# Altium schematic sheet CONNECTOR_DBG.SchDoc: CONNECTOR
size A4; Revision: V2.0; SheetNumber: 6; SheetTotal: 7; Project: PY32F403v1xT_START
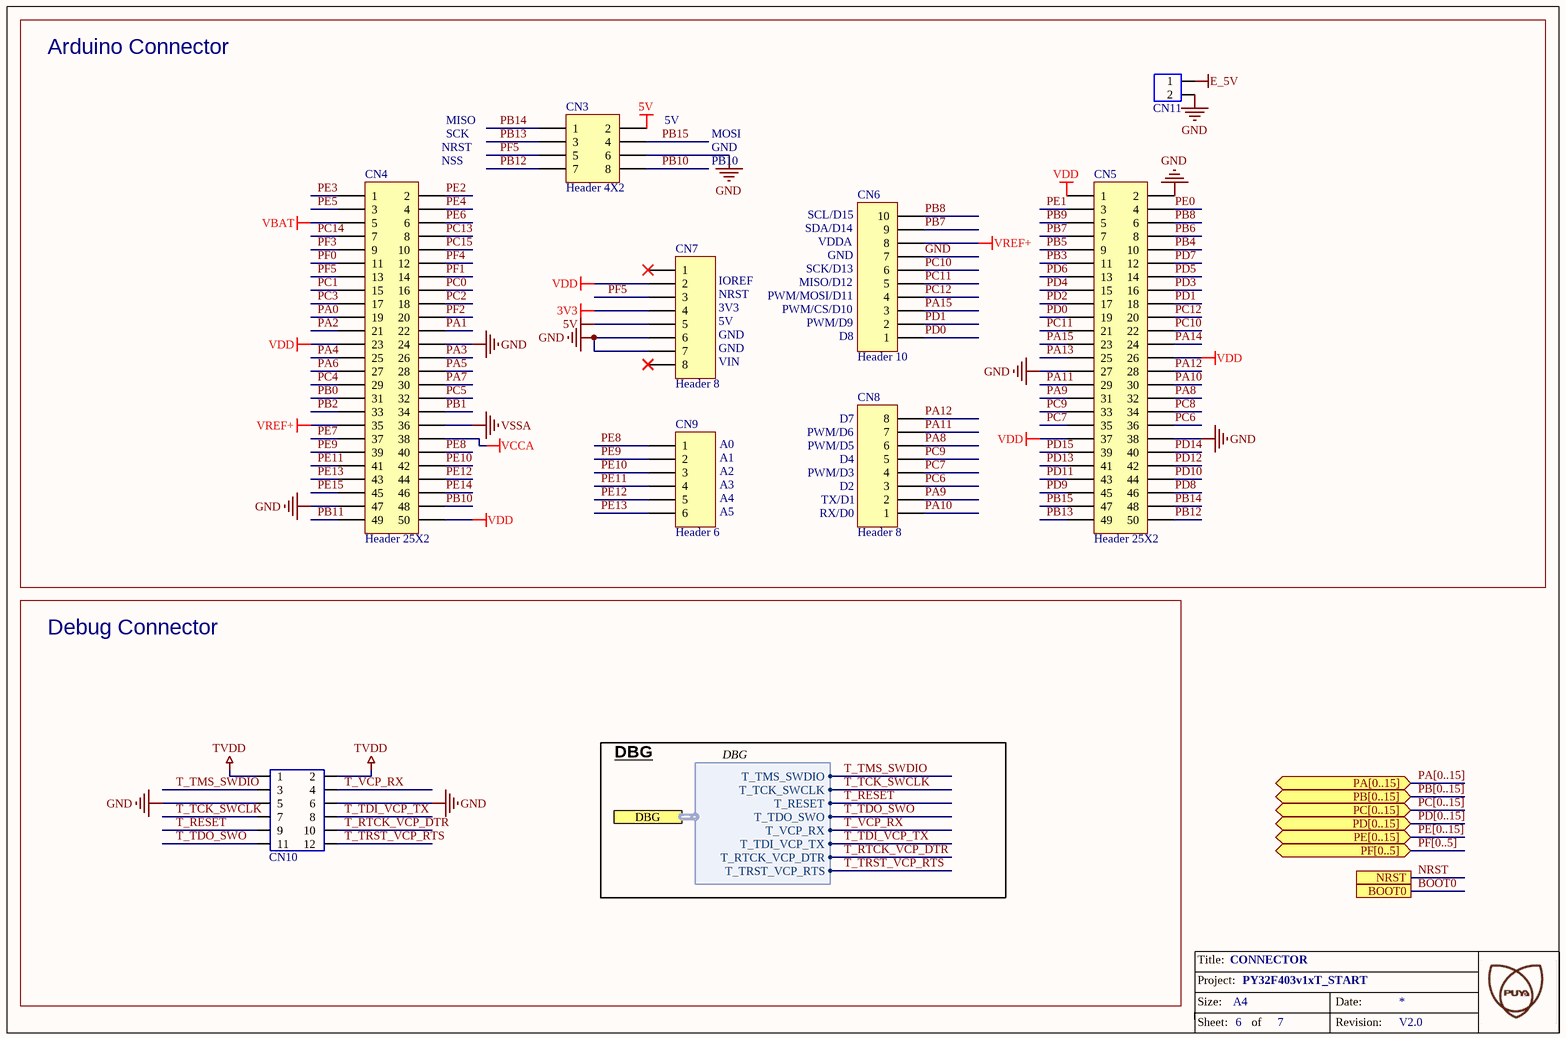
[diagram p0: CONNECTOR_DBG.SchDoc]

## Parts
CN3  Header 4X2  [HDR2X4]
CN4  Header 25X2  [HDR2X25]
CN5  Header 25X2  [HDR2X25]
CN6  Header 10  [1*10P_FEMALE]
CN7  Header 8  [1*8P_FEMALE]
CN8  Header 8  [1*8P_FEMALE]
CN9  Header 6  [1*6P_FEMALE]
CN10  CON6x2  [CON6x2]  (value not drawn)
CN11  CON2  [CON2]  (value not drawn)

## Blocks framed on the sheet
Arduino Connector: CN3-CN9 CN11
Debug Connector: CN10

## Ports
BOOT0, DBG (harness DBG), NRST, PA[0..15] (bidir), PB[0..15] (bidir), PC[0..15] (bidir), PD[0..15] (bidir), PE[0..15] (bidir), PF[0..5] (bidir)

## Harnesses
DBG: T_VCP_RX, T_TDO_SWO, T_RESET, T_TMS_SWDIO, T_TDI_VCP_TX, T_TCK_SWCLK, T_RTCK_VCP_DTR, T_TRST_VCP_RTS

## Nets
3V3: CN7.4
5V: CN3.2 CN7.5
E_5V: CN11.1
GND: CN3.6 CN4.24 CN4.47 CN5.2 CN5.27 CN5.38 CN6.7 CN7.6 CN7.7 CN10.5 CN10.6 CN11.2
TVDD: CN10.1 CN10.2
VBAT: CN4.5
VCCA: CN4.38
VDD: CN4.23 CN4.50 CN5.1 CN5.26 CN5.37 CN7.2
VREF+: CN4.35 CN6.8
VSSA: CN4.36
BOOT0: port BOOT0
NRST: port NRST
PA0: CN4.19
PA1: CN4.22
PA2: CN4.21
PA3: CN4.26
PA4: CN4.25
PA5: CN4.28
PA6: CN4.27
PA7: CN4.30
PA8: CN5.32 CN8.6
PA9: CN5.31 CN8.2
PA10: CN5.30 CN8.1
PA11: CN5.29 CN8.7
PA12: CN5.28 CN8.8
PA13: CN5.25
PA14: CN5.24
PA15: CN5.23 CN6.3
PB0: CN4.31
PB1: CN4.34
PB2: CN4.33
PB3: CN5.11
PB4: CN5.10
PB5: CN5.9
PB6: CN5.8
PB7: CN5.7 CN6.9
PB8: CN5.6 CN6.10
PB9: CN5.5
PB10: CN3.8 CN4.48
PB11: CN4.49
PB12: CN3.7 CN5.50
PB13: CN3.3 CN5.49
PB14: CN3.1 CN5.48
PB15: CN3.4 CN5.47
PC0: CN4.16
PC1: CN4.15
PC2: CN4.18
PC3: CN4.17
PC4: CN4.29
PC5: CN4.32
PC6: CN5.36 CN8.3
PC7: CN5.35 CN8.4
PC8: CN5.34
PC9: CN5.33 CN8.5
PC10: CN5.22 CN6.6
PC11: CN5.21 CN6.5
PC12: CN5.20 CN6.4
PC13: CN4.8
PC14: CN4.7
PC15: CN4.10
PD0: CN5.19 CN6.1
PD1: CN5.18 CN6.2
PD2: CN5.17
PD3: CN5.16
PD4: CN5.15
PD5: CN5.14
PD6: CN5.13
PD7: CN5.12
PD8: CN5.46
PD9: CN5.45
PD10: CN5.44
PD11: CN5.43
PD12: CN5.42
PD13: CN5.41
PD14: CN5.40
PD15: CN5.39
PE0: CN5.4
PE1: CN5.3
PE2: CN4.2
PE3: CN4.1
PE4: CN4.4
PE5: CN4.3
PE6: CN4.6
PE7: CN4.37
PE8: CN4.40 CN9.1
PE9: CN4.39 CN9.2
PE10: CN4.42 CN9.3
PE11: CN4.41 CN9.4
PE12: CN4.44 CN9.5
PE13: CN4.43 CN9.6
PE14: CN4.46
PE15: CN4.45
PF0: CN4.11
PF1: CN4.14
PF2: CN4.20
PF3: CN4.9
PF4: CN4.12
PF5: CN3.5 CN4.13 CN7.3
T_RESET: CN10.9 ; port DBG.T_RESET
T_RTCK_VCP_DTR: CN10.10 ; port DBG.T_RTCK_VCP_DTR
T_TCK_SWCLK: CN10.7 ; port DBG.T_TCK_SWCLK
T_TDI_VCP_TX: CN10.8 ; port DBG.T_TDI_VCP_TX
T_TDO_SWO: CN10.11 ; port DBG.T_TDO_SWO
T_TMS_SWDIO: CN10.3 ; port DBG.T_TMS_SWDIO
T_TRST_VCP_RTS: CN10.12 ; port DBG.T_TRST_VCP_RTS
T_VCP_RX: CN10.4 ; port DBG.T_VCP_RX

Not connected (* = marked no-connect by the designer): CN7 1* 8*

## Buses and harness runs
bus PA[0..15] = port PA[0..15]
bus PB[0..15] = port PB[0..15]
bus PC[0..15] = port PC[0..15]
bus PD[0..15] = port PD[0..15]
bus PE[0..15] = port PE[0..15]
bus PF[0..5] = port PF[0..5]

## Notes on the sheet
- (near CN4) NRST
- (near CN4) NSS
- MISO
- SCK
- (near CN3) 5V
- MOSI
- GND
- PB10
- (near CN6) SDA/D14
- (near CN6) SCL/D15
- VDDA
- (near CN7) IOREF
- (near CN7) NRST
- (near CN7) 3V3
- PWM/MOSI/D11
- PWM/CS/D10
- (near CN6) MISO/D12
- (near CN6) SCK/D13
- (near CN6) GND
- (near CN7) 5V
- (near CN7) GND
- (near CN7) VIN
- PWM/D9
- (near CN6) D8
- (near CN9) A0
- PWM/D6
- PWM/D5
- (near CN8) D7
- (near CN9) A1
- (near CN9) A2
- (near CN9) A3
- (near CN9) A4
- (near CN9) A5
- (near CN8) PWM/D3
- (near CN8) RX/D0
- (near CN8) TX/D1
- (near CN8) D4
- (near CN8) D2
- DBG
- Title:
- Project:
- Size:
- Sheet:
- of
- Date:
- Revision:

## Library data of the parts
CN3 = Header 4X2: Header, 4-Pin, Dual row; LatestRevisionDate: 17-Jul-2002; LatestRevisionNote: Re-released for DXP Platform.; Publisher: Altium Limited
CN4 CN5 = Header 25X2: Header, 25-Pin, Dual row; LatestRevisionDate: 17-Jul-2002; LatestRevisionNote: Re-released for DXP Platform.; Publisher: Altium Limited
CN6 = Header 10: Header, 10-Pin; LatestRevisionDate: 17-Jul-2002; LatestRevisionNote: Re-released for DXP Platform.; Publisher: Altium Limited
CN7 CN8 = Header 8: Header, 8-Pin; LatestRevisionDate: 17-Jul-2002; LatestRevisionNote: Re-released for DXP Platform.; Publisher: Altium Limited
CN9 = Header 6: Header, 6-Pin; LatestRevisionDate: 17-Jul-2002; LatestRevisionNote: Re-released for DXP Platform.; Publisher: Altium Limited
CN10 = CON6x2: PCB DECAL: CON5x2